# EAGLE design ManualFloatRelaysV2 (EAGLE 9.6.2)
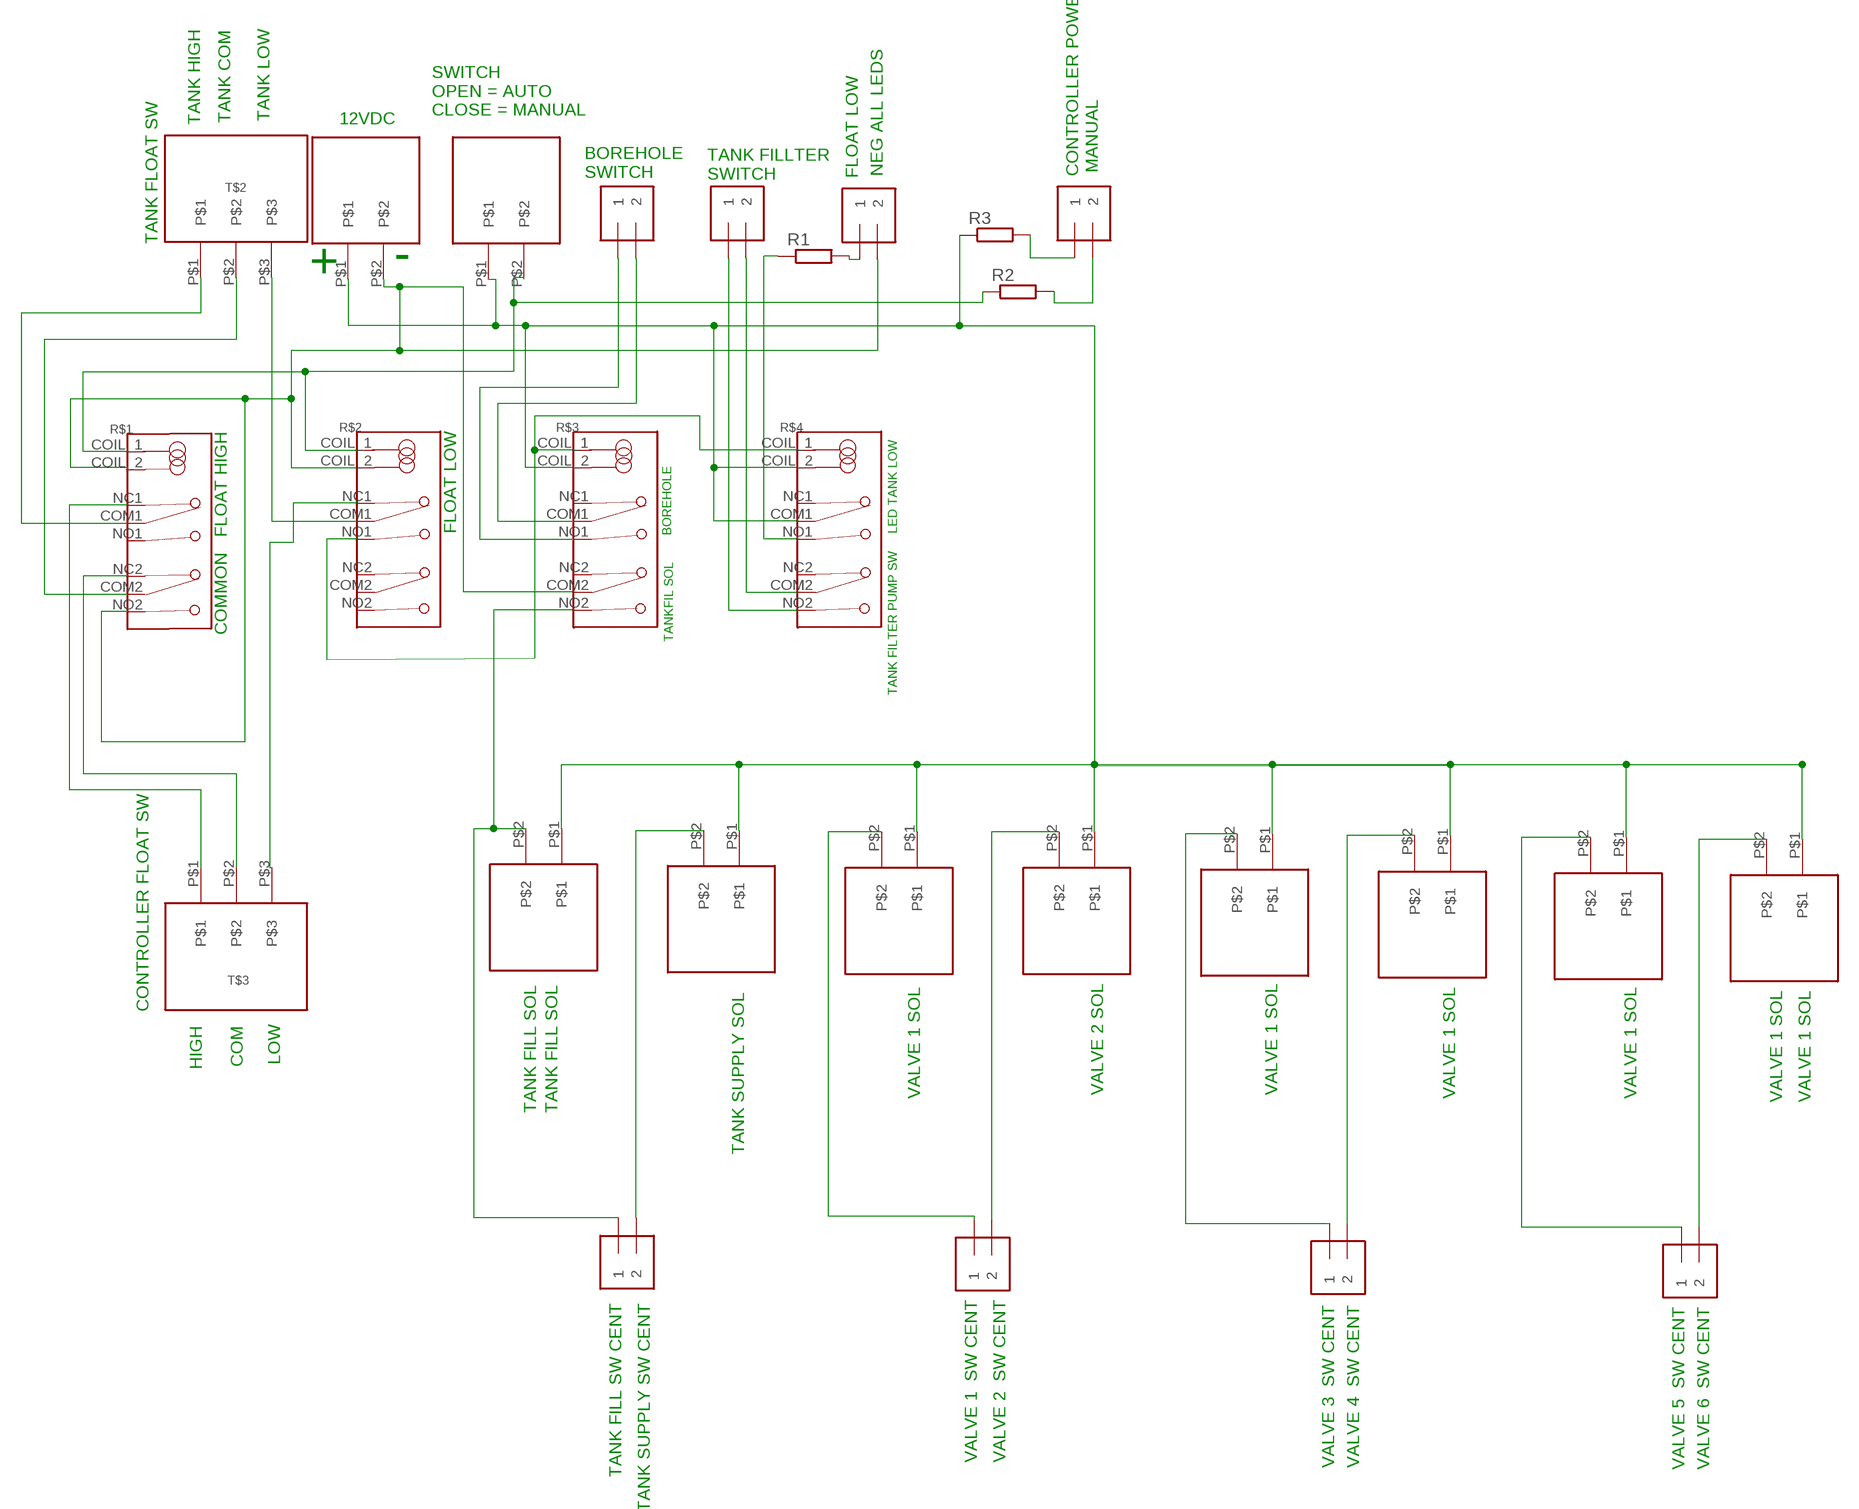
[diagram p0: schematic, sheet 1]

## Parts
R1  R-EU_0207/10  [0207/10]
R2  R-EU_0207/10  [0207/10]
R3  R-EU_0207/10  [0207/10]
R$1  RELAY_LM2-12DL  [RELAY4078]
R$2  RELAY_LM2-12DL  [RELAY4078]
R$3  RELAY_LM2-12DL  [RELAY4078]
R$4  RELAY_LM2-12DL  [RELAY4078]
T$1  TERMINNAL-3.5MM-2-3.5MMDOUBLE  [1X2-3.5MM]
T$2  TERMINAL-3.5MM-3TERMINAL  [1X3-3.5MM_TERM]
T$3  TERMINAL-3.5MM-3TERMINAL  [1X3-3.5MM_TERM]
T$4  TERMINNAL-3.5MM-2-3.5MMDOUBLE  [1X2-3.5MM]
T$5  TERMINNAL-3.5MM-2-3.5MMDOUBLE  [1X2-3.5MM]
T$6  TERMINNAL-3.5MM-2-3.5MMDOUBLE  [1X2-3.5MM]
T$7  TERMINNAL-3.5MM-2-3.5MMDOUBLE  [1X2-3.5MM]
T$11  TERMINNAL-3.5MM-2-3.5MMDOUBLE  [1X2-3.5MM]
T$13  TERMINNAL-3.5MM-2-3.5MMDOUBLE  [1X2-3.5MM]
T$14  TERMINNAL-3.5MM-2-3.5MMDOUBLE  [1X2-3.5MM]
U$1  TERMINAL-5.08MM-2BIG_HOLE  [TERM-5.05-2_BH]
U$2  TERMINAL-5.08MM-2BIG_HOLE  [TERM-5.05-2_BH]
U$3  TERMINAL-5.08MM-2BIG_HOLE  [TERM-5.05-2_BH]
U$4  TERMINAL-5.08MM-2BIG_HOLE  [TERM-5.05-2_BH]
U$5  TERMINAL-5.08MM-2BIG_HOLE  [TERM-5.05-2_BH]
U$6  TERMINAL-5.08MM-2BIG_HOLE  [TERM-5.05-2_BH]
U$7  TERMINAL-5.08MM-2BIG_HOLE  [TERM-5.05-2_BH]
U$8  TERMINAL-5.08MM-2BIG_HOLE  [TERM-5.05-2_BH]
U$9  TERMINAL-5.08MM-2BIG_HOLE  [TERM-5.05-2_BH]
U$10  TERMINAL-5.08MM-2BIG_HOLE  [TERM-5.05-2_BH]

## Nets
N$1: R$2.NO1 R$3.COIL_1(COIL1) R$4.COIL_1(COIL1)
N$2 [POWER]: T$11.1 U$4.P$2
N$3: R2.1 R$1.COIL_1(COIL1) R$2.COIL_1(COIL1) U$10.P$2
N$4 [POWER]: R$1.COIL_2(COIL2) R$1.NO2 R$2.COIL_2(COIL2) R$3.COM2 T$4.2 U$2.P$2
N$5 [3V]: R$1.COM1 T$2.P$1
N$6 [3V]: R$1.COM2 T$2.P$2
N$7 [3V]: R$2.COM1 T$2.P$3
N$8: R$1.NC1 T$3.P$1
N$9: R$1.NC2 T$3.P$2
N$10: R$2.NC1 T$3.P$3
N$11 [3V]: R$3.NO1 T$5.1
N$12 [3V]: R$3.COM1 T$5.2
N$13 [POWER]: R$3.NO2 T$7.1 U$1.P$2
N$14 [3V]: R$4.COM2 T$1.2
N$15 [POWER]: T$13.1 U$5.P$2
N$16 [3V]: R$4.NO2 T$1.1
N$17 [POWER]: T$7.2 U$3.P$2
N$18 [POWER]: T$11.2 U$6.P$2
N$19 [POWER]: R3.1 R$3.COIL_2(COIL2) R$4.COIL_2(COIL2) R$4.COM1 U$1.P$1 U$2.P$1 U$3.P$1 U$4.P$1 U$5.P$1 U$6.P$1 U$7.P$1 U$8.P$1 U$9.P$1 U$10.P$1
N$20 [POWER]: T$13.2 U$8.P$2
N$21 [POWER]: T$14.1 U$7.P$2
N$22 [POWER]: T$14.2 U$9.P$2
N$23: R1.1 R$4.NO1
N$24: R1.2 T$4.1
N$25: R2.2 T$6.2
N$26: R3.2 T$6.1
Unconnected: R$1.NO1 R$2.COM2 R$2.NC2 R$2.NO2 R$3.NC1 R$3.NC2 R$4.NC1 R$4.NC2

## Notes on the sheet
- SWITCH
  OPEN = AUTO
  CLOSE = MANUAL
- TANK HIGH | TANK COM | TANK LOW | 12VDC
- NEG ALL LEDS | CONTROLLER POWER | MANUAL
- BOREHOLE 
  SWITCH
- FLOAT LOW
- TANK FILLTER
  SWITCH
- TANK FLOAT SW
- + | -
- FLOAT HIGH | FLOAT LOW | BOREHOLE | LED TANK LOW
- COMMON
- TANKFIL SOL
- TANK FILTER PUMP SW
- TANK FILL SOL | TANK FILL SOL | VALVE 1 SOL | VALVE 2 SOL | VALVE 1 SOL | VALVE 1 SOL | VALVE 1 SOL
- TANK SUPPLY SOL | VALVE 1 SOL | VALVE 1 SOL
- CONTROLLER FLOAT SW
- HIGH | COM | LOW
- TANK FILL SW CENT | TANK SUPPLY SW CENT | VALVE 1  SW CENT | VALVE 2  SW CENT
- VALVE 3  SW CENT | VALVE 4  SW CENT | VALVE 5  SW CENT | VALVE 6  SW CENT

## Library data of the parts
R1-R3 = rcl:R-EU_: RESISTOR, European symbol; SPICEPREFIX: R
R$1-R$4 = BDV_02:RELAY_LM2-12DL: Relay Small Symbol
T$1 T$4-T$7 T$11 T$13 T$14 = BDV_02:TERMINNAL-3.5MM-2: 3.5mm Terminal block http://www.ladyada.net/library/pcb/eaglelibrary.html
T$2 T$3 = BDV_02:TERMINAL-3.5MM-3: 3 Pin Connector
U$1-U$10 = BDV_02:TERMINAL-5.08MM-2: Terminal 5.08mm - 2

## Net classes
0 default: width 0.4 mm, drill 0.635 mm, clearance 0.635 mm
1 POWER: width 1.5 mm, drill 0.635 mm, clearance 0.635 mm
2 12V: width 0.635 mm, drill 0.635 mm, clearance 0.635 mm
4 3V: width 0.8 mm, drill 0.635 mm, clearance 0.635 mm
5 GND: width 0.635 mm, drill 0.635 mm, clearance 0.635 mm

## Board
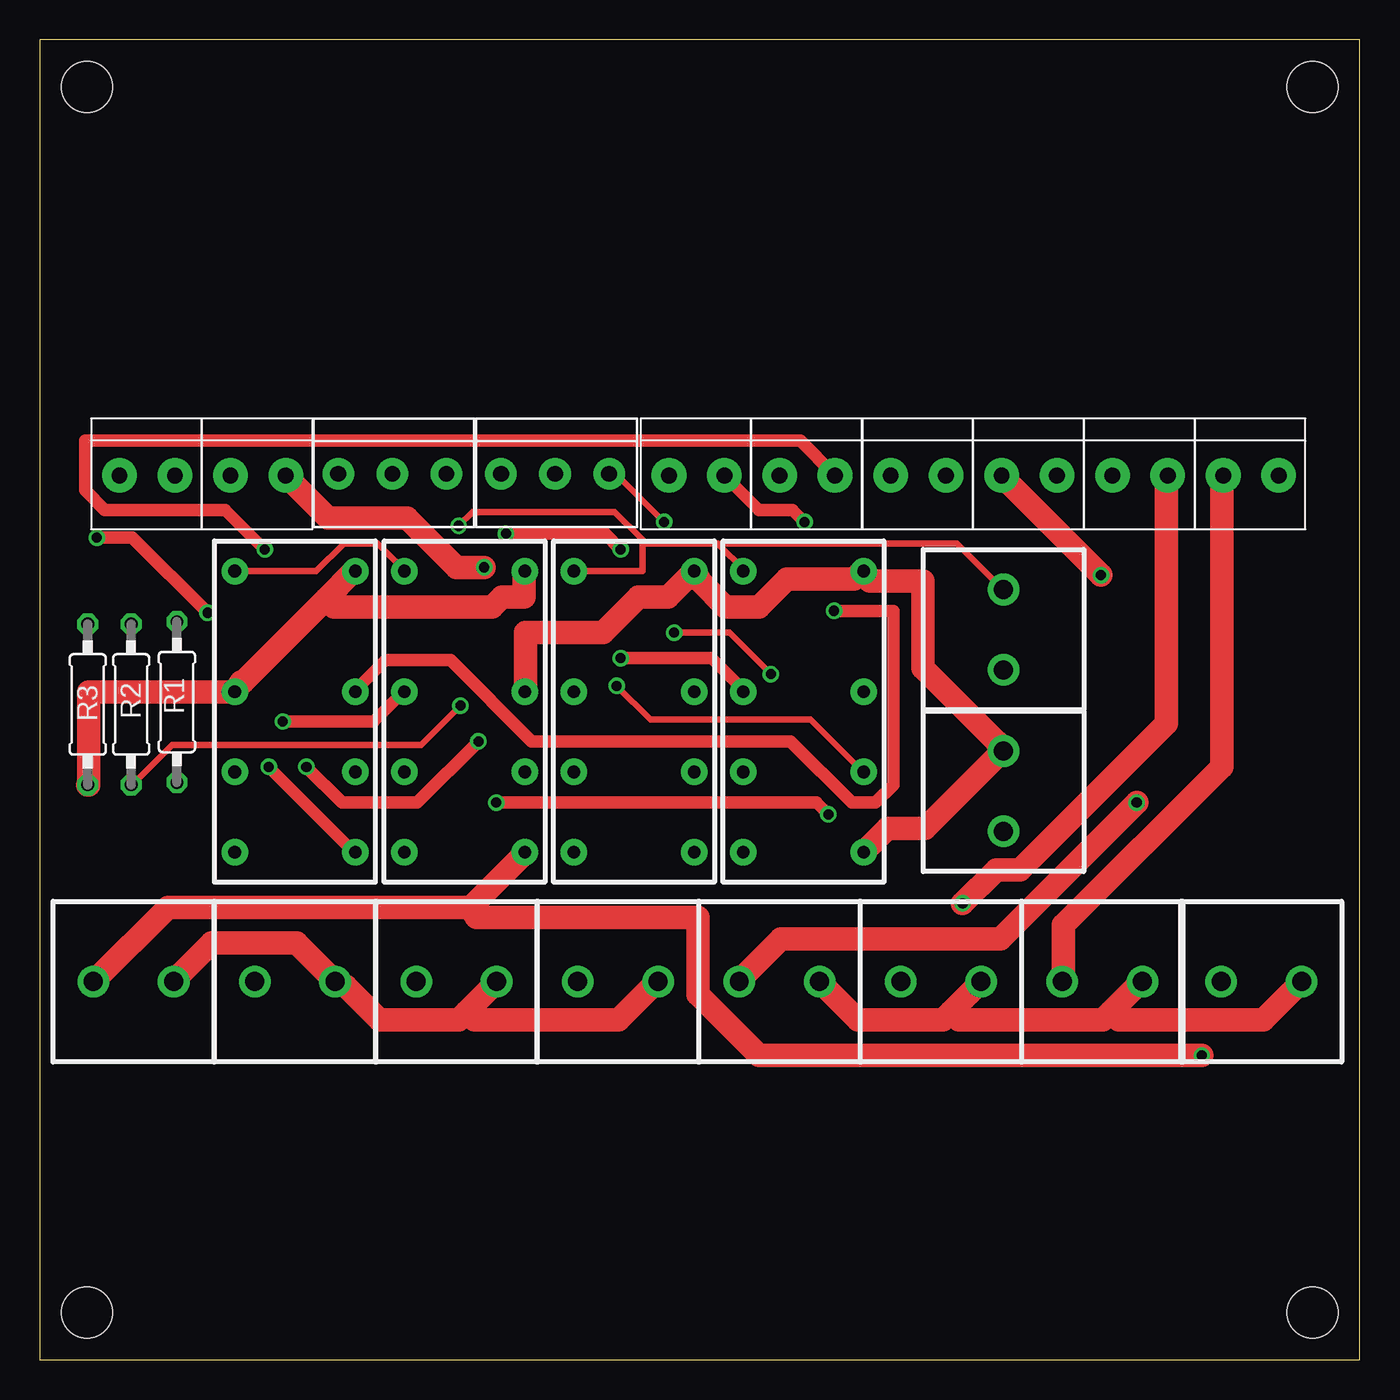
[diagram p1: board, top side]
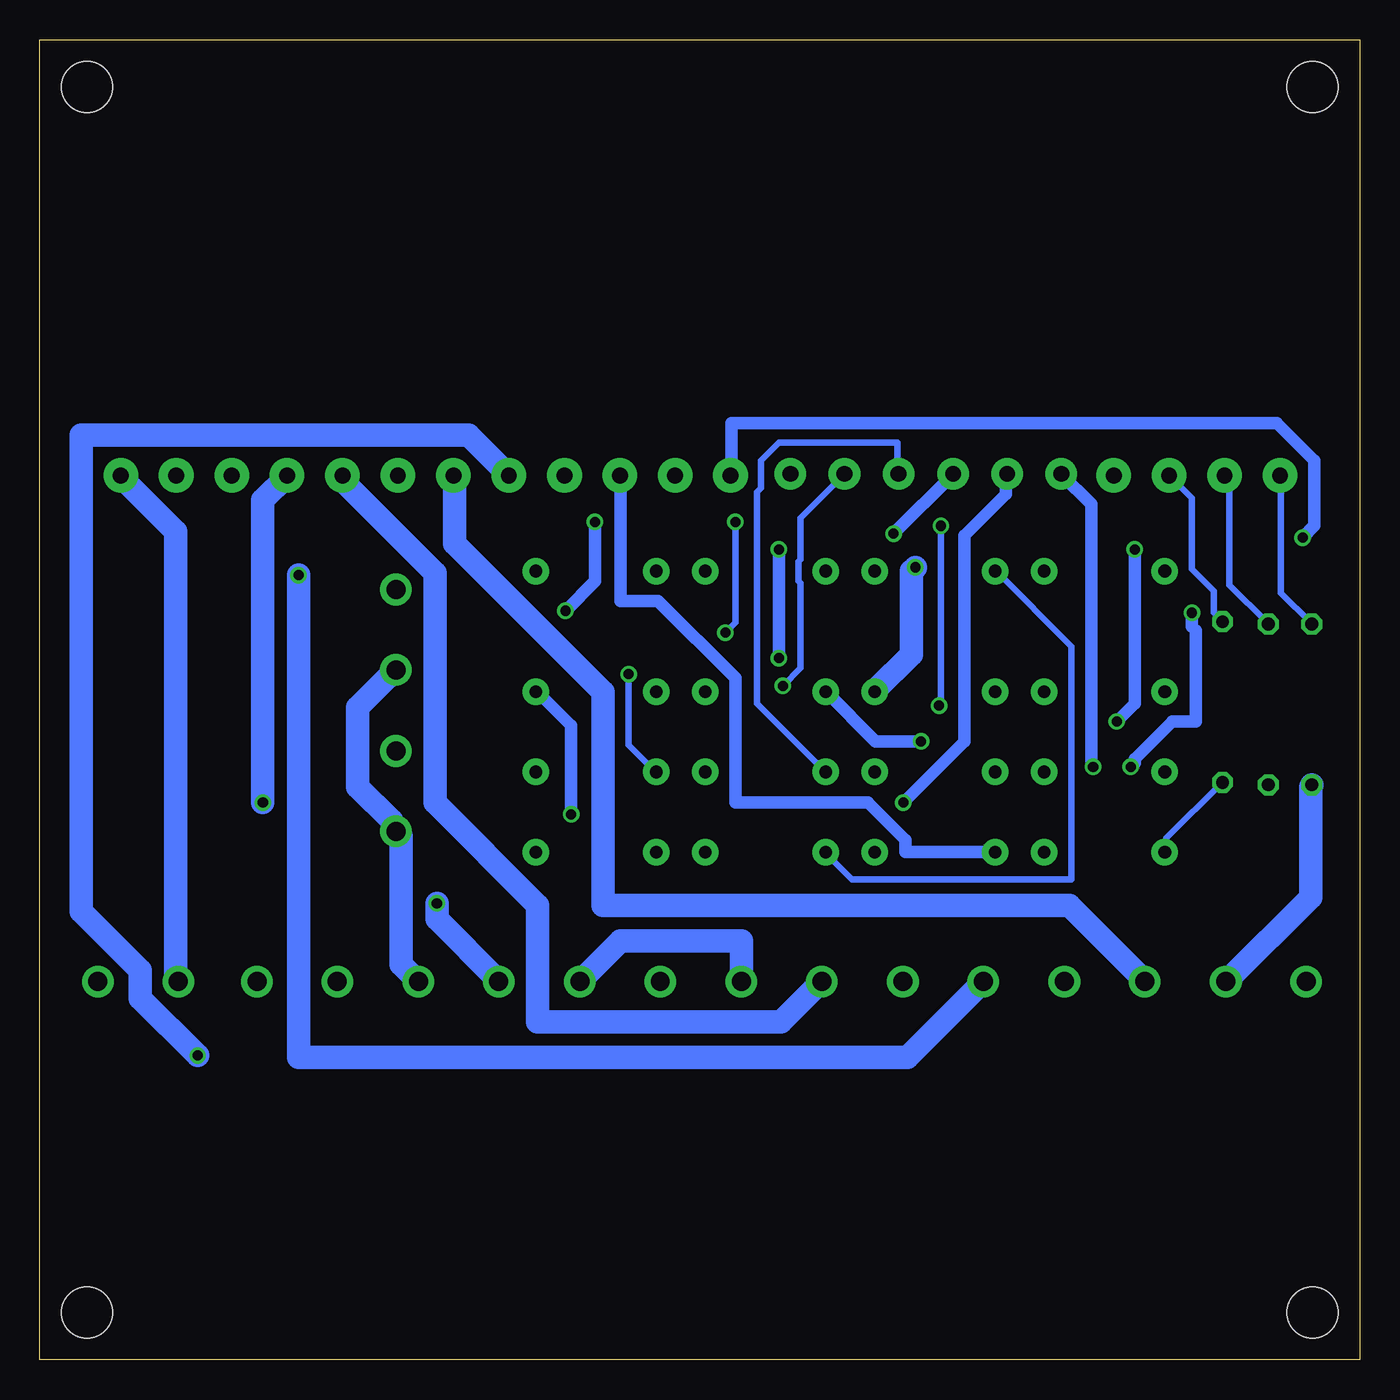
[diagram p2: board, bottom side, seen from below]

Size 83.5 x 83.5 mm. Coordinates in mm from the lower left corner, seen from the top.
Outline: 0,0 83.5,0 83.5,83.5 0,83.5 0,0
Copper layers (1*16): Top 0.035mm / dielectric 1.5mm / Bottom 0.035mm
Design rules "default *": minimum track width 6mil, minimum drill 0.35mm, track to track 6mil, track to pad 6mil, pad to pad 6mil, via to via 6mil, smd to smd 6mil, copper to edge 40mil, drill to drill 6mil, minimum pad ring 10mil, minimum via ring 8mil, stop-mask expansion 4mil, vias tented up to drill 20mil, thermal gap 10mil
Holes 3.2 mm at 3,3 3,80.5 80.5,80.5 80.5,3

### Footprints (pad centres in the part's own frame; a part is rotated, then mirrored left to right if it is on the bottom)
0207/10 = drill 0.813 octagon: 1 -5.08,0; 2 5.08,0
RELAY4078 = drill 0.8 pad 1.676: COIL_1 -3.81,8.89; COIL_2 3.81,8.89; COM1 -3.81,1.27; COM2 3.81,1.27; NC1 -3.81,-3.81; NC2 3.81,-3.81; NO1 -3.81,-8.89; NO2 3.81,-8.89
1X2-3.5MM = drill 1 pad 2.184: 1 1.8,0; 2 -1.7,0
1X3-3.5MM_TERM = drill 1 pad 2: P$1 -3.32,-0.586; P$2 0.1,-0.586; P$3 3.52,-0.586
TERM-5.05-2_BH = drill 1.2 pad 2: P$1 0,2.54; P$2 0,-2.54

### Placement (x,y rotation side)
R1  8.69,41.61 90 top
R2  5.79,41.45 90 top
R3  3.05,41.45 90 top
R$1  48.31,41 0 top
R$2  37.59,41 0 top
R$3  26.87,41 0 top
R$4  16.15,41 0 top
T$1  41.61,55.93 180 top
T$2  22.41,55.45 180 top
T$3  32.7,55.45 180 top
T$4  13.87,55.93 180 top
T$5  48.6,55.93 180 top
T$6  6.86,55.93 180 top
T$7  55.63,55.93 180 top
T$11  62.64,55.93 180 top
T$13  69.65,55.93 180 top
T$14  76.66,55.93 180 top
U$1  5.94,23.93 270 top
U$2  60.96,35.97 180 top
U$3  16.15,23.93 270 top
U$4  26.37,23.93 270 top
U$5  46.79,23.93 270 top
U$6  36.58,23.93 270 top
U$7  67.21,23.93 270 top
U$8  57,23.93 270 top
U$9  77.27,23.93 270 top
U$10  60.96,46.18 180 top

### Tracks (layer width: path | path; a pad name or v marks a point on that pad's centre or on a via)
N$1
  Top 0.4: R$4.COIL_1 12.38,49.88 17.5,49.88 19.25,51.62 21.38,51.62 23,50 R$3.COIL_1
  Bottom 0.4: R$2.NO1 33.75,32 32.12,30.38 18.25,30.38 18.25,45.12 23,49.88 R$3.COIL_1
N$2  (via drill 0.64)
  Top 1.5: v67.12,49.62 60.88,55.88 T$11.1
  Bottom 1.5: v67.12,49.62 67.12,19.12 28.62,19.12 23.88,23.88 U$4.P$2
N$3  (via drill 0.64)
  Top 0.4: v26.62,41.38 24.12,38.88 8.38,38.88 5.88,36.38 R2.1 | v26.5,52.75 27.38,53.62 36.38,53.62 38.12,51.88 38.12,51.62 | 38.12,51.62 38.12,49.88 33.88,49.88 R$2.COIL_1 | 43,51.5 42.88,51.62 38.12,51.62 | 43,51.5 44.5,50 R$1.COIL_1 | U$10.P$2 60.88,48.75 58,51.62 43.12,51.62 43,51.5
  Bottom 0.4: v26.62,41.38 26.5,41.5 v26.5,52.75
N$4  (via drill 0.64)
  Top 1.5: R$1.NO2 52.12,32.12 53.62,33.62 56,33.62 60.88,38.5 U$2.P$2 60.5,39.12 55.88,43.75 55.88,49.25 52.5,49.25 R$1.COIL_2 52,49.88 51.5,49.38 47.25,49.38 45.5,47.62 43.38,47.62 41.75,49.25 R$2.COIL_2 41.38,49.88 39.75,48.25 37.88,48.25 35.62,46 30.75,46 30.75,42.38 R$3.COM2 | v28.12,50.12 26.38,50.12 23.25,53.25 18.25,53.25 15.62,55.88 T$4.2
  Bottom 1.5: v28.12,50.12 28.38,49.88 28.38,44.62 30.62,42.38 R$3.COM2
N$5  (via drill 0.64)
  Top 0.8: v36.75,44.38 42.5,44.38 44.5,42.38 R$1.COM1 | v36.75,51.25 35.75,52.25 v29.5,52.25
  Bottom 0.8: v36.75,51.25 v36.75,44.38 | v29.5,52.25 25.75,56 T$2.P$1
N$6  (via drill 0.64)
  Top 0.8: v49.88,34.5 49.12,35.25 v28.88,35.25
  Bottom 0.8: v49.88,34.5 49.88,40.12 52,42.25 R$1.COM2 | v28.88,35.25 25,39.12 25,52.12 22.38,54.75 22.38,56 T$2.P$2
N$7  (via drill 0.64)
  Top 0.8: v27.75,39.12 23.88,35.25 19.12,35.25 v16.88,37.5
  Bottom 0.8: v27.75,39.12 30.62,39.12 33.75,42.25 R$2.COM1 | v16.88,37.5 17,37.62 17,54.12 18.88,56 T$2.P$3
N$8  (via drill 0.64)
  Top 0.4: v46.25,43.38 43.62,46 v40.12,46 | v39.5,53 36.5,56 36.12,56 T$3.P$1
  Bottom 0.4: v46.25,43.38 46.25,38.88 44.62,37.25 R$1.NC1 | v40.12,46 39.5,46.62 v39.5,53
N$9  (via drill 0.64)
  Top 0.4: v36.5,42.62 38.62,40.5 48.75,40.5 52,37.25 R$1.NC2
  Bottom 0.4: v36.5,42.62 35.38,43.75 35.38,49.12 35.5,49.25 35.5,50.5 35.38,50.62 35.38,53.25 32.62,56 T$3.P$2
N$10
  Bottom 0.4: R$2.NC1 33.88,37.25 38.12,41.5 38.12,54.88 37.88,55.12 37.88,56.88 36.75,58 29.25,58 29.25,56.12 T$3.P$3
N$11
  Bottom 0.8: R$3.NO1 23.12,32.12 28.75,32.12 28.75,32.88 31.12,35.25 39.5,35.25 39.5,43.12 44.38,48 46.75,48 46.75,55.88 T$5.1
N$12  (via drill 0.64)
  Top 0.8: v15.38,40.38 21.12,40.38 23,42.25 R$3.COM1 | v14.25,51.25 11.75,53.75 4.12,53.75 2.88,55 2.88,58.12 48.12,58.12 50.25,56 T$5.2
  Bottom 0.8: v15.38,40.38 14.25,41.5 v14.25,51.25
N$13  (via drill 0.64)
  Top 1.5: 27.25,28.62 30.62,32 R$3.NO2 | 27.25,28.62 8.12,28.62 3.5,24 U$1.P$2 | v73.5,19.25 45.5,19.25 41.62,23.12 41.62,28 27.62,28 27.25,28.62
  Bottom 1.5: v73.5,19.25 77.12,22.88 77.12,24.62 80.88,28.38 80.88,58.5 56.38,58.5 53.88,56 T$7.1
N$14  (via drill 0.64)
  Top 0.8: v50.25,47.38 54,47.38 54,36.38 52.88,35.25 51.38,35.25 47.5,39.12 31.12,39.12 26,44.25 21.88,44.25 20,42.38 R$4.COM2 | v48.38,53 47.62,53.75 45.5,53.75 43.38,55.88 T$1.2
  Bottom 0.8: v50.25,47.38 48.38,49.25 v48.38,53
N$15  (via drill 0.64)
  Top 1.5: v69.38,35.25 60.75,26.62 46.88,26.62 44.25,24 U$5.P$2
  Bottom 1.5: v69.38,35.25 69.38,54.38 67.88,55.88 T$13.1
N$16  (via drill 0.64)
  Top 0.8: v14.5,37.5 19.88,32.12 R$4.NO2 | v10.62,47.25 5.88,52 v3.62,52
  Bottom 0.8: v14.5,37.5 14.25,37.75 14.25,38 11.88,40.38 10.38,40.38 10.38,46.12 10.62,46.38 v10.62,47.25 | v3.62,52 2.88,52.75 2.88,56.88 5.25,59.25 39.75,59.25 39.75,56 T$1.1
N$17
  Bottom 1.5: U$3.P$2 13.62,24 18.38,28.75 47.88,28.75 47.88,42.25 57.25,51.62 57.25,55.88 T$7.2
N$18
  Bottom 1.5: U$6.P$2 34.12,23.88 36.62,21.38 52,21.38 52,28.75 58.5,35.25 58.5,49.75 64.25,55.5 64.25,55.88 T$11.2
N$19
  Top 1.5: 57.62,22 59.5,23.88 U$8.P$1 | 57.62,22 57.12,21.5 51.75,21.5 49.38,23.88 U$5.P$1 | 67.75,22 67.25,21.5 58.12,21.5 57.62,22 | 67.75,22 69.62,23.88 U$7.P$1 | U$9.P$1 79.75,23.88 77.38,21.5 68.25,21.5 67.75,22 | U$1.P$1 8.5,24 10.88,26.38 16.25,26.38 18.62,24 U$3.P$1 19.38,23.62 21.5,21.5 26.5,21.5 27,22 | 27,22 28.88,23.88 U$4.P$1 | U$6.P$1 39,23.88 36.62,21.5 27.5,21.5 27,22 | R3.1 3.12,36.38 3.12,42.25 12.25,42.25 R$4.COM1 12.75,42.88 12.88,42.88 18.12,48.12 | 18.12,48.12 19.88,49.88 R$4.COIL_2 | R$3.COIL_2 30.62,49.88 30.62,48.25 29.25,48.25 28.62,47.62 18.62,47.62 18.12,48.12
  Bottom 1.5: U$8.P$1 59.62,24 60.62,25 60.62,33.12 60.88,33.38 U$2.P$1 61.25,34.12 63.38,36.25 63.38,41.25 61,43.62 U$10.P$1 | U$1.P$1 8.38,24 3.12,29.25 3.12,36.25 R3.1 | U$5.P$1 49.25,24 46.75,26.5 39.12,26.5 39.12,24 U$6.P$1
N$20  (via drill 0.64)
  Top 1.5: v58.38,28.88 60.5,31 62,31 71.25,40.25 71.25,55.88 T$13.2
  Bottom 1.5: v58.38,28.88 58.38,27.88 54.5,24 U$8.P$2
N$21
  Top 1.5: U$7.P$2 64.75,24 64.75,27.5 74.75,37.5 74.75,55.88 T$14.1
N$22
  Bottom 1.5: U$9.P$2 74.75,24 74.88,24.12 74.88,52.38 78.25,55.75 78.25,55.88 T$14.2
N$23
  Bottom 0.4: R1.1 8.75,36.5 12.25,33 12.25,32.12 R$4.NO1
N$24
  Bottom 0.4: R1.2 8.75,46.75 9.25,47.25 9.25,48.62 10.62,50 10.62,54.5 12,55.88 T$4.1
N$25
  Bottom 0.4: R2.2 5.88,46.62 8.25,49 8.25,55.62 8.5,55.88 T$6.2
N$26
  Bottom 0.4: R3.2 3.12,46.62 5,48.5 5,55.88 T$6.1

### Text on the board
tValues: LED - (POWER) | LED + (MANUAL ON) | LED + (TANK LOW) | LED - (ALL) | TANK FLOAT HIGH | TANK FLOAT COM | TANK FLOAT LOW | CONTROL FL HIGH | CONTROL FL COM | CONTROL FL LOW | TANK FILTER SW | TANK FILTER SW | BOREHOLE SW | BOREHOLE SW | TANK FIL SW CENT | TANK SUP SW CENT | VALVE 1 SW CENT | VALVE 2 SW CENT | VALVE 3 SW CENT | VALVE 4 SW CENT | VALVE 5 SW CENT | VALVE 6 SW CENT | MANUAL SW | GND | +12V | TANK FILL / SOLENOID | TANK SUPPLY / SOLENOID | VALVE 1 / SOLENOID | VALVE 2 / SOLENOID | VALVE 3 / SOLENOID | VALVE 4 / SOLENOID | VALVE 5 / SOLENOID | VALVE 6 / SOLENOID